# Altium schematic sheet Rpull_Section2.SchDoc
size A4
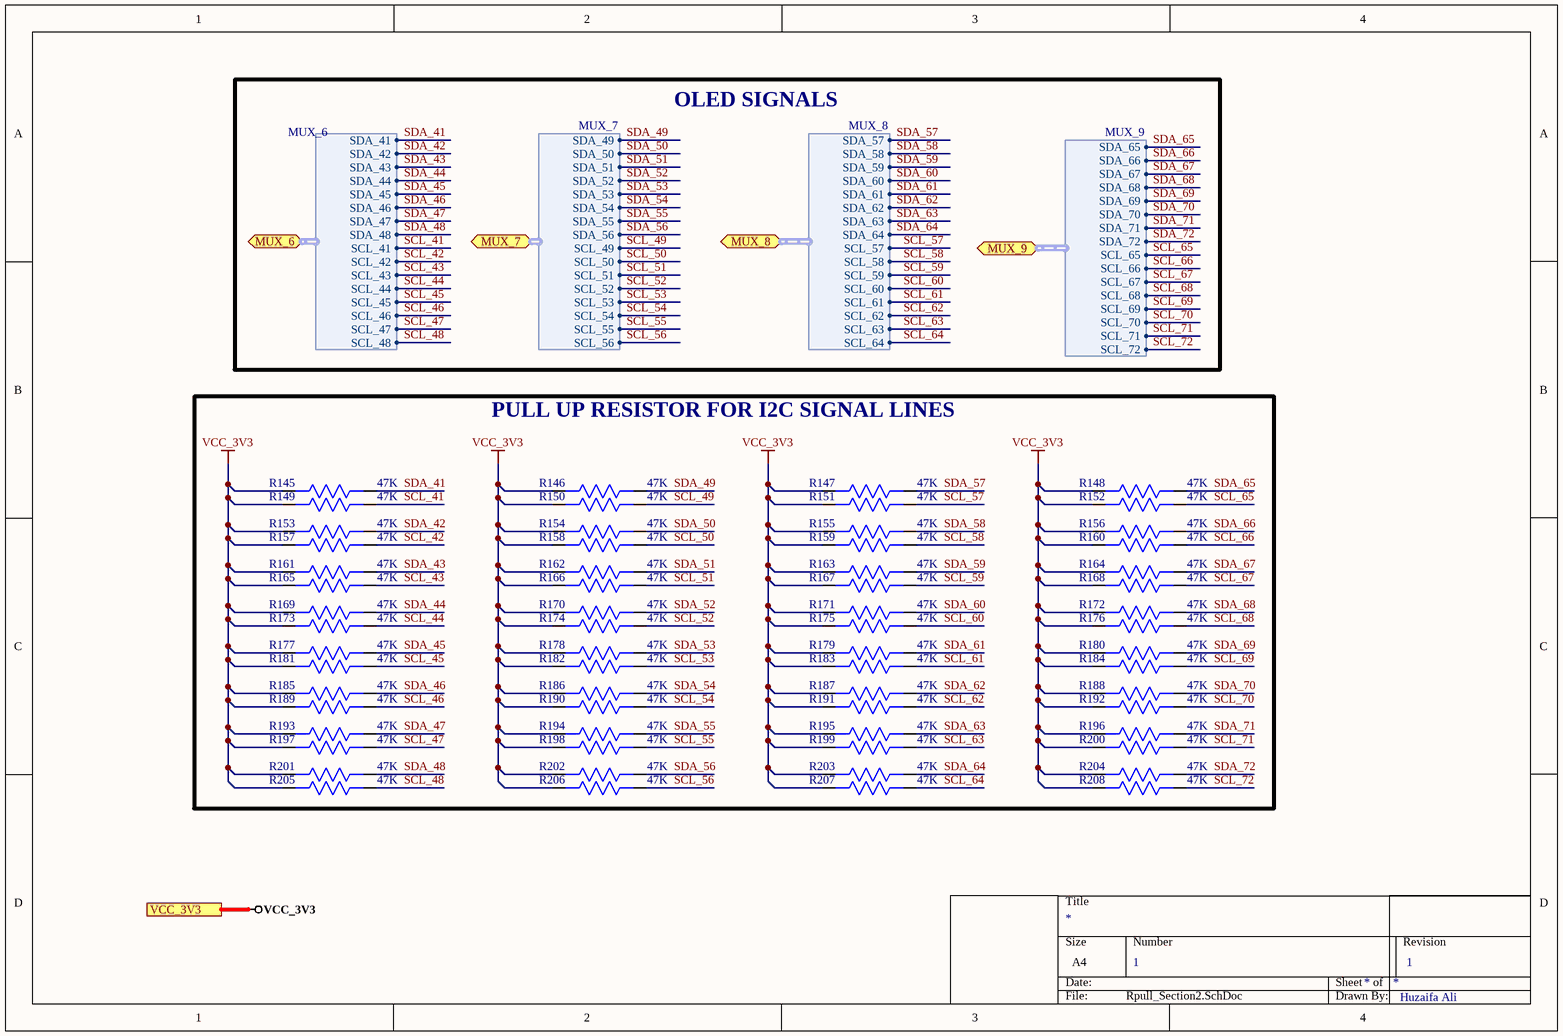
[diagram p0: Rpull_Section2.SchDoc]

## Parts
R145  47K  [Res0402]
R146  47K  [Res0402]
R147  47K  [Res0402]
R148  47K  [Res0402]
R149  47K  [Res0402]
R150  47K  [Res0402]
R151  47K  [Res0402]
R152  47K  [Res0402]
R153  47K  [Res0402]
R154  47K  [Res0402]
R155  47K  [Res0402]
R156  47K  [Res0402]
R157  47K  [Res0402]
R158  47K  [Res0402]
R159  47K  [Res0402]
R160  47K  [Res0402]
R161  47K  [Res0402]
R162  47K  [Res0402]
R163  47K  [Res0402]
R164  47K  [Res0402]
R165  47K  [Res0402]
R166  47K  [Res0402]
R167  47K  [Res0402]
R168  47K  [Res0402]
R169  47K  [Res0402]
R170  47K  [Res0402]
R171  47K  [Res0402]
R172  47K  [Res0402]
R173  47K  [Res0402]
R174  47K  [Res0402]
R175  47K  [Res0402]
R176  47K  [Res0402]
R177  47K  [Res0402]
R178  47K  [Res0402]
R179  47K  [Res0402]
R180  47K  [Res0402]
R181  47K  [Res0402]
R182  47K  [Res0402]
R183  47K  [Res0402]
R184  47K  [Res0402]
R185  47K  [Res0402]
R186  47K  [Res0402]
R187  47K  [Res0402]
R188  47K  [Res0402]
R189  47K  [Res0402]
R190  47K  [Res0402]
R191  47K  [Res0402]
R192  47K  [Res0402]
R193  47K  [Res0402]
R194  47K  [Res0402]
R195  47K  [Res0402]
R196  47K  [Res0402]
R197  47K  [Res0402]
R198  47K  [Res0402]
R199  47K  [Res0402]
R200  47K  [Res0402]
R201  47K  [Res0402]
R202  47K  [Res0402]
R203  47K  [Res0402]
R204  47K  [Res0402]
R205  47K  [Res0402]
R206  47K  [Res0402]
R207  47K  [Res0402]
R208  47K  [Res0402]

## Blocks framed on the sheet
PULL UP RESISTOR FOR I2C SIGNAL LINES: R145-R208

## Ports
MUX_6 (bidir, harness MUX_6), MUX_7 (bidir, harness MUX_7), MUX_8 (bidir, harness MUX_8), MUX_9 (bidir, harness MUX_9), VCC_3V3

## Harnesses
MUX_7: SDA_49, SDA_50, SDA_51, SDA_52, SDA_53, SDA_54, SDA_55, SDA_56, SCL_49, SCL_50, SCL_51, SCL_52, SCL_53, SCL_54, SCL_55, SCL_56
MUX_8: SDA_57, SDA_58, SDA_59, SDA_60, SDA_61, SDA_62, SDA_63, SDA_64, SCL_57, SCL_58, SCL_59, SCL_60, SCL_61, SCL_62, SCL_63, SCL_64
MUX_9: SDA_65, SDA_66, SDA_67, SDA_68, SDA_69, SDA_70, SDA_71, SDA_72, SCL_65, SCL_66, SCL_67, SCL_68, SCL_69, SCL_70, SCL_71, SCL_72
MUX_6: SDA_41, SDA_42, SDA_43, SDA_44, SDA_45, SDA_46, SDA_47, SDA_48, SCL_41, SCL_42, SCL_43, SCL_44, SCL_45, SCL_46, SCL_47, SCL_48

## Nets
VCC_3V3: R145.2 R146.2 R147.2 R148.2 R149.2 R150.2 R151.2 R152.2 R153.2 R154.2 R155.2 R156.2 R157.2 R158.2 R159.2 R160.2 R161.2 R162.2 R163.2 R164.2 R165.2 R166.2 R167.2 R168.2 R169.2 R170.2 R171.2 R172.2 R173.2 R174.2 R175.2 R176.2 R177.2 R178.2 R179.2 R180.2 R181.2 R182.2 R183.2 R184.2 R185.2 R186.2 R187.2 R188.2 R189.2 R190.2 R191.2 R192.2 R193.2 R194.2 R195.2 R196.2 R197.2 R198.2 R199.2 R200.2 R201.2 R202.2 R203.2 R204.2 R205.2 R206.2 R207.2 R208.2 ; port VCC_3V3
SCL_41: R149.1 ; port MUX_6.SCL_41
SCL_42: R157.1 ; port MUX_6.SCL_42
SCL_43: R165.1 ; port MUX_6.SCL_43
SCL_44: R173.1 ; port MUX_6.SCL_44
SCL_45: R181.1 ; port MUX_6.SCL_45
SCL_46: R189.1 ; port MUX_6.SCL_46
SCL_47: R197.1 ; port MUX_6.SCL_47
SCL_48: R205.1 ; port MUX_6.SCL_48
SCL_49: R150.1 ; port MUX_7.SCL_49
SCL_50: R158.1 ; port MUX_7.SCL_50
SCL_51: R166.1 ; port MUX_7.SCL_51
SCL_52: R174.1 ; port MUX_7.SCL_52
SCL_53: R182.1 ; port MUX_7.SCL_53
SCL_54: R190.1 ; port MUX_7.SCL_54
SCL_55: R198.1 ; port MUX_7.SCL_55
SCL_56: R206.1 ; port MUX_7.SCL_56
SCL_57: R151.1 ; port MUX_8.SCL_57
SCL_58: R159.1 ; port MUX_8.SCL_58
SCL_59: R167.1 ; port MUX_8.SCL_59
SCL_60: R175.1 ; port MUX_8.SCL_60
SCL_61: R183.1 ; port MUX_8.SCL_61
SCL_62: R191.1 ; port MUX_8.SCL_62
SCL_63: R199.1 ; port MUX_8.SCL_63
SCL_64: R207.1 ; port MUX_8.SCL_64
SCL_65: R152.1 ; port MUX_9.SCL_65
SCL_66: R160.1 ; port MUX_9.SCL_66
SCL_67: R168.1 ; port MUX_9.SCL_67
SCL_68: R176.1 ; port MUX_9.SCL_68
SCL_69: R184.1 ; port MUX_9.SCL_69
SCL_70: R192.1 ; port MUX_9.SCL_70
SCL_71: R200.1 ; port MUX_9.SCL_71
SCL_72: R208.1 ; port MUX_9.SCL_72
SDA_41: R145.1 ; port MUX_6.SDA_41
SDA_42: R153.1 ; port MUX_6.SDA_42
SDA_43: R161.1 ; port MUX_6.SDA_43
SDA_44: R169.1 ; port MUX_6.SDA_44
SDA_45: R177.1 ; port MUX_6.SDA_45
SDA_46: R185.1 ; port MUX_6.SDA_46
SDA_47: R193.1 ; port MUX_6.SDA_47
SDA_48: R201.1 ; port MUX_6.SDA_48
SDA_49: R146.1 ; port MUX_7.SDA_49
SDA_50: R154.1 ; port MUX_7.SDA_50
SDA_51: R162.1 ; port MUX_7.SDA_51
SDA_52: R170.1 ; port MUX_7.SDA_52
SDA_53: R178.1 ; port MUX_7.SDA_53
SDA_54: R186.1 ; port MUX_7.SDA_54
SDA_55: R194.1 ; port MUX_7.SDA_55
SDA_56: R202.1 ; port MUX_7.SDA_56
SDA_57: R147.1 ; port MUX_8.SDA_57
SDA_58: R155.1 ; port MUX_8.SDA_58
SDA_59: R163.1 ; port MUX_8.SDA_59
SDA_60: R171.1 ; port MUX_8.SDA_60
SDA_61: R179.1 ; port MUX_8.SDA_61
SDA_62: R187.1 ; port MUX_8.SDA_62
SDA_63: R195.1 ; port MUX_8.SDA_63
SDA_64: R203.1 ; port MUX_8.SDA_64
SDA_65: R148.1 ; port MUX_9.SDA_65
SDA_66: R156.1 ; port MUX_9.SDA_66
SDA_67: R164.1 ; port MUX_9.SDA_67
SDA_68: R172.1 ; port MUX_9.SDA_68
SDA_69: R180.1 ; port MUX_9.SDA_69
SDA_70: R188.1 ; port MUX_9.SDA_70
SDA_71: R196.1 ; port MUX_9.SDA_71
SDA_72: R204.1 ; port MUX_9.SDA_72

## Notes on the sheet
- OLED SIGNALS
- 1
- Huzaifa Ali

## Library data of the parts
R145-R208 = RC0402FR-0747KL: RES SMD 47K OHM 1% 1/16W 0402; Manufacturer: Yageo; Power Rating: 62.5mW; Temperature Coefficient: 100ppm/°C; Voltage Rating: 50V; Resistance: 47kR; Max Power Dissipation: 63mW; Supplier 1: Digi-Key; Manufacturer Part Number: RC0402FR-0747KL; Stock 1: 0; Pricing 1: 1=0.1, 10=0.016, 100=0.0064, 1000=0.00289, 2500=0.00251, 5000=0.00207 (USD); Case/Package: 0402; Case Code (Imperial): 0402; Case Code (Metric): 1005; Min Operating Temperature: -55°C; Max Operating Temperature: 155°C; Tolerance: 1%; Packaging: Tape and Reel; Package Quantity: 1; Termination: SMD/SMT; Composition: Thick Film; Number of Terminations: 2; Military Standard: Not; Features: Moisture Resistant; Length: 1mm; Height: 0.016inch; Depth: 0.5mm; Width: 0.5mm; REACH SVHC: Unknown; Lead Free: Lead Free; ComponentLink1URL: http://www.yageo.com/documents/recent/PYu-RC0402_51_RoHS_L_6_r.pdf?src-supplier=Future+Electronics; ComponentLink1Description: http://www.yageo.com/documents/recent/PYu-RC0402_51_RoHS_L_6_r.pdf?src-supplier=Future+Electronics; ComponentLink2URL: http://www.farnell.com/datasheets/1018594.pdf?src-supplier=Element14; ComponentLink2Description: http://www.farnell.com/datasheets/1018594.pdf?src-supplier=Element14; ComponentLink3URL: https://www.verical.com/server-webapp/html/getDatasheet?partID=323748&src-supplier=Verical; ComponentLink3Description: https://www.verical.com/server-webapp/html/getDatasheet?partID=323748&src-supplier=Verical; ComponentLink4URL: http://www.yageo.com/documents/recent/PYu-RC_Group_51_RoHS_L_10.pdf?src-supplier=Digi-Key; ComponentLink4Description: http://www.yageo.com/documents/recent/PYu-RC_Group_51_RoHS_L_10.pdf?src-supplier=Digi-Key; Supplier Part Number 1: 311-47.0KLRDKR-ND